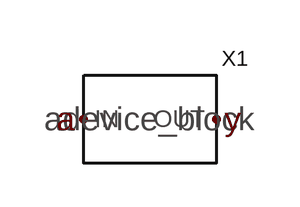
[diagram p0: schematic adevice_block_top.asc]
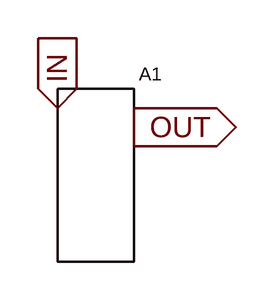
[diagram p1: sub-circuit adevice_block.asc]
adevice_block_top.asc, the LTspice schematic file:
Version 4
SHEET 1 880 680
FLAG 112 16 a
FLAG 208 16 y
SYMBOL adevice_block 160 16 R0
SYMATTR InstName X1

adevice_block.asc, the sub-circuit schematic file:
Version 4
SHEET 1 880 680
FLAG 64 64 IN
IOPIN 64 64 In
FLAG 128 80 OUT
IOPIN 128 80 Out
SYMBOL a8 96 64 R0
SYMATTR InstName A1

The netlist it stands for:
* adevice_block_top.asc
XX1 a y adevice_block

* block symbol definitions
.subckt adevice_block IN OUT
A1 IN 0 0 0 0 0 OUT 0 AND
.ends adevice_block

.backanno
.end